# Altium project Drone_PCB.PrjPcb
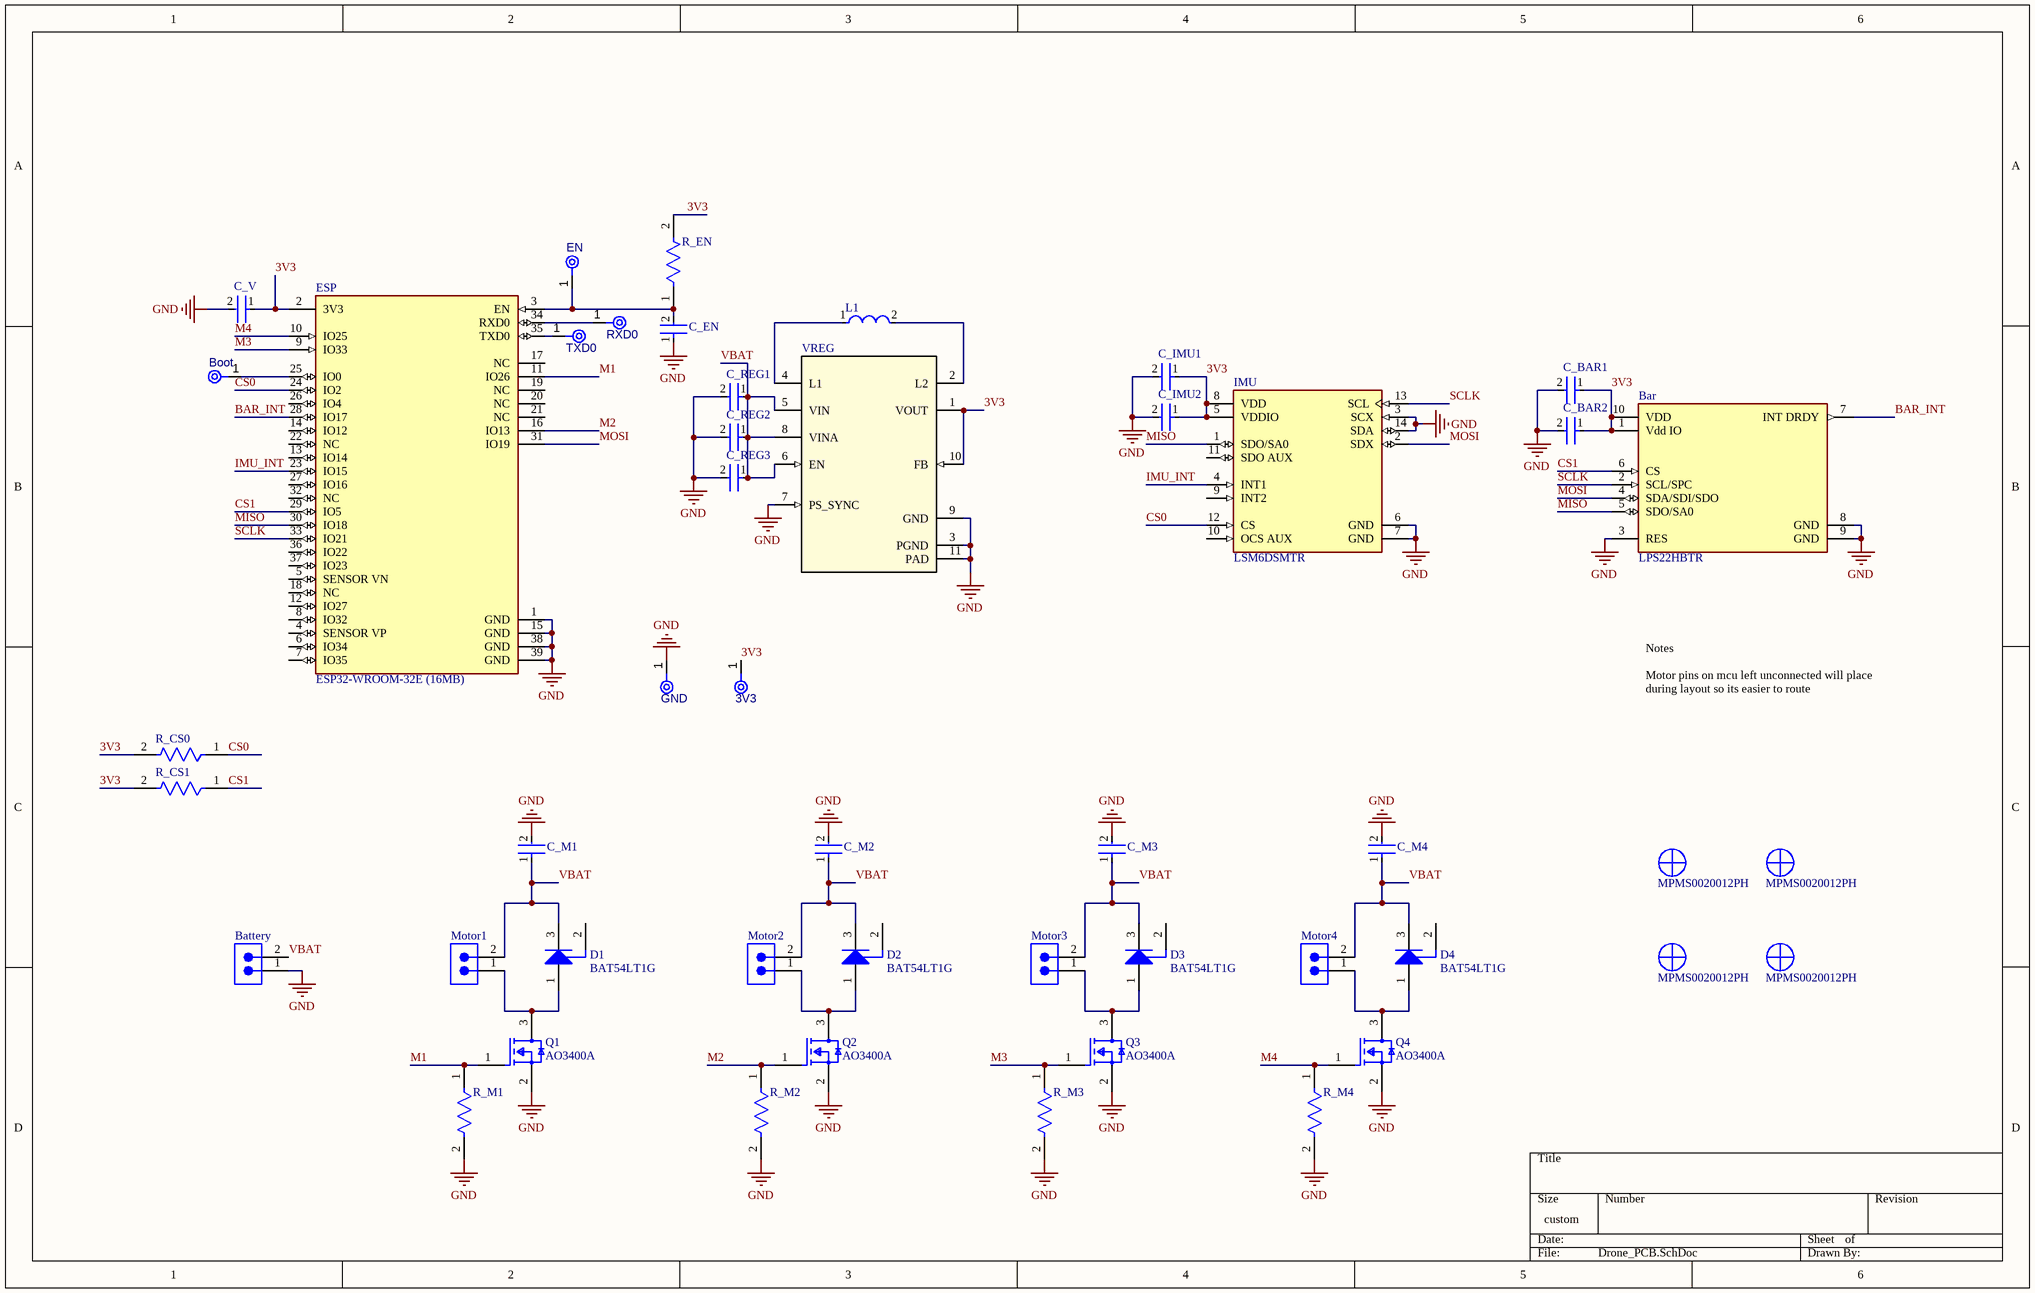
[diagram p0: Drone_PCB.SchDoc]
1 sheet, 48 parts. Net scope: global (net labels, ports and power ports of the same name join across sheets).
Board file: Drone_PCB.PcbDoc

## Sheet Drone_PCB.SchDoc
size 381 x 241 mm; SheetNumber: 1; SheetTotal: 1

### Parts
3V3  (no value)  [TP06R]  (no BOM)
Bar  LPS22HBTR  [FP-HLGA-10L-8479831-0]
Battery  (no value)  [61300211121]
Boot  (no value)  [TP06R]  (no BOM)
C_BAR1  (no value)  [FP-CL93-IPC_C]
C_BAR2  (no value)  [FP-CL93-IPC_C]
C_EN  (no value)  [FP-CL93-IPC_C]
C_IMU1  (no value)  [FP-CL93-IPC_C]
C_IMU2  (no value)  [FP-CL93-IPC_C]
C_M1  (no value)  [FP-CL93-IPC_C]
C_M2  (no value)  [FP-CL93-IPC_C]
C_M3  (no value)  [FP-CL93-IPC_C]
C_M4  (no value)  [FP-CL93-IPC_C]
C_REG1  (no value)  [FP-CL93-IPC_C]
C_REG2  (no value)  [FP-CL93-IPC_C]
C_REG3  (no value)  [FP-CL93-IPC_C]
C_V  (no value)  [FP-CL93-IPC_C]
D1  BAT54LT1G  [ONSC-SOT-23-3-318-08_V]
D2  BAT54LT1G  [ONSC-SOT-23-3-318-08_V]
D3  BAT54LT1G  [ONSC-SOT-23-3-318-08_V]
D4  BAT54LT1G  [ONSC-SOT-23-3-318-08_V]
EN  (no value)  [TP06R]  (no BOM)
ESP  ESP32-WROOM-32E (16MB)  [FP-ESP32-WROOM-32E_16MB-MFG]
GND  (no value)  [TP06R]  (no BOM)
IMU  LSM6DSMTR  [FP-LGA-14L-DM00249496-MFG]
L1  (no value)  [FP-MLZ2012-1_25-IPC_A]
MH1  MPMS0020012PH  [BF-MPMS0020012PH]
MH2  MPMS0020012PH  [BF-MPMS0020012PH]
MH3  MPMS0020012PH  [BF-MPMS0020012PH]
MH4  MPMS0020012PH  [BF-MPMS0020012PH]
Motor1  (no value)  [61300211121]
Motor2  (no value)  [61300211121]
Motor3  (no value)  [61300211121]
Motor4  (no value)  [61300211121]
Q1  AO3400A  [FP-SOT23-MFG]
Q2  AO3400A  [FP-SOT23-MFG]
Q3  AO3400A  [FP-SOT23-MFG]
Q4  AO3400A  [FP-SOT23-MFG]
R_CS0  (no value)  [FP-RC0603-0_55-MFG]
R_CS1  (no value)  [FP-RC0603-0_55-MFG]
R_EN  (no value)  [FP-RC0603-0_55-MFG]
R_M1  (no value)  [FP-RC0603-0_55-MFG]
R_M2  (no value)  [FP-RC0603-0_55-MFG]
R_M3  (no value)  [FP-RC0603-0_55-MFG]
R_M4  (no value)  [FP-RC0603-0_55-MFG]
RXD0  (no value)  [TP06R]  (no BOM)
TXD0  (no value)  [TP06R]  (no BOM)
VREG  TPS63031DSKR  [DSK0010A]  (value not drawn)

### Nets
GND: Bar.3(RES) Bar.8(GND) Bar.9(GND) Battery.1 C_BAR1.2 C_BAR2.2 C_EN.1 C_IMU1.2 C_IMU2.2 C_M1.2 C_M2.2 C_M3.2 C_M4.2 C_REG1.2 C_REG2.2 C_REG3.2 C_V.2 ESP.1(GND) ESP.15(GND) ESP.38(GND) ESP.39(GND) GND.1(TP) IMU.3(SCX) IMU.6(GND) IMU.7(GND) IMU.14(SDA) Q1.2(S) Q2.2(S) Q3.2(S) Q4.2(S) R_M1.2 R_M2.2 R_M3.2 R_M4.2 VREG.3(PGND) VREG.7(PS_SYNC) VREG.9(GND) VREG.11(PAD)
3V3: 3V3.1(TP) Bar.1(Vdd_IO) Bar.10(VDD) C_BAR1.1 C_BAR2.1 C_IMU1.1 C_IMU2.1 C_V.1 ESP.2(3V3) IMU.5(VDDIO) IMU.8(VDD) R_CS0.2 R_CS1.2 R_EN.2 VREG.1(VOUT) VREG.10(FB)
BAR_INT: Bar.7(INT_DRDY) ESP.28(IO17)
CS0: ESP.24(IO2) IMU.12(CS) R_CS0.1
CS1: Bar.6(CS) ESP.29(IO5) R_CS1.1
IMU_INT: ESP.23(IO15) IMU.4(INT1)
M1: ESP.11(IO26) Q1.1(G) R_M1.1
M2: ESP.16(IO13) Q2.1(G) R_M2.1
M3: ESP.9(IO33) Q3.1(G) R_M3.1
M4: ESP.10(IO25) Q4.1(G) R_M4.1
MISO: Bar.5(SDO/SA0) ESP.30(IO18) IMU.1(SDO/SA0)
MOSI: Bar.4(SDA/SDI/SDO) ESP.31(IO19) IMU.2(SDX)
SCLK: Bar.2(SCL/SPC) ESP.33(IO21) IMU.13(SCL)
VBAT: Battery.2 C_M1.1 C_M2.1 C_M3.1 C_M4.1 C_REG1.1 C_REG2.1 C_REG3.1 D1.3(K) D2.3(K) D3.3(K) D4.3(K) Motor1.2 Motor2.2 Motor3.2 Motor4.2 VREG.5(VIN) VREG.6(EN) VREG.8(VINA)
NetBoot_1: Boot.1(TP) ESP.25(IO0)
NetC_EN_2: C_EN.2 EN.1(TP) ESP.3(EN) R_EN.1
NetD1_1: D1.1(A) Motor1.1 Q1.3(D)
NetD2_1: D2.1(A) Motor2.1 Q2.3(D)
NetD3_1: D3.1(A) Motor3.1 Q3.3(D)
NetD4_1: D4.1(A) Motor4.1 Q4.3(D)
NetESP_34: ESP.34(RXD0) RXD0.1(TP)
NetESP_35: ESP.35(TXD0) TXD0.1(TP)
NetL1_1: L1.1 VREG.4(L1)
NetL1_2: L1.2 VREG.2(L2)

Not connected (* = marked no-connect by the designer): D1 2(NC); D2 2(NC); D3 2(NC); D4 2(NC); ESP 4(SENSOR_VP) 5(SENSOR_VN) 6(IO34) 7(IO35) 8(IO32) 12(IO27) 13(IO14) 14(IO12) 17(NC) 18(NC) 19(NC) 20(NC) 21(NC) 22(NC) 26(IO4) 27(IO16) 32(NC) 36(IO22) 37(IO23); IMU 9(INT2) 10(OCS_AUX) 11(SDO_AUX); MH1 1; MH2 1; MH3 1; MH4 1

### Notes on the sheet
- Notes
  Motor pins on mcu left unconnected will place during layout so its easier to route

### Library data of the parts
3V3 Boot EN GND RXD0 TXD0 = CMP-00028-00002-2: 0.6mm round; Pins: 1
Bar = CMP-12182-000004-1: MEMS NANO PRESSURE SENSOR: 260-1; Manufacturer: STMicroelectronics; Sensor Output: I2C,SPI; Port Style: No Port; Max Supply Voltage: 3.6V; Operating Supply Current: 3-12uA; Min Supply Voltage: 1.7V; Device Class L3: unset; Device Class L1: Sensors; Manufacturer Part Number: LPS22HBTR; Temperature Range High: +85°C; Digikey Description: MEMS NANO PRESSURE SENSOR: 260-1; Device Class L2: Pressure Sensors; RoHS: TRUE; Lead Free: Yes; Height: 0.8mm; Automotive: No; Octopart: https://octopart.com/lps22hbtr-stmicroelectronics-51851131; Package: HLGA-10L-8479831; Temperature Range Low: -40°C; Category: IC; Temperature: -40°C to +85°C; ComponentLink2Description: Datasheet; ComponentLink2URL: https://www.st.com/resource/en/datasheet/lps22hb.pdf; Footprint Url: https://www.st.com/content/ccc/resource/technical/document/technical_note/73/17/9c/16/dd/96/4a/01/CD00134799.pdf/files/CD00134799.pdf/jcr:content/translations/en.CD00134799.pdf
Battery Motor1-Motor4 = CMP-1712-00002-7: THT Vertical Pin Header WR-PHD, Pitch 2.54 mm, Single Row, 2 pins; Pitch: 2.54mm; Number of Contacts: 2; Connector Type: Male Pin; Gender: Male; Contact Resistance: 20mΩ; Operating Supply Voltage: 250V; Current Rating: 3A; Housing Material: PBT; RoHS: Compliant; Lead Free: Lead Free; Contact Material: Gold; REACH SVHC: No; Min Operating Temperature: -40°C; Termination: Through Hole; Number of Pins: 2; Contact Gender: Male; Packaging: Bulk; Lead Pitch: 2.54mm; Contact Plating: Gold; Orientation: Vertical; Mount: Through Hole; Height: 8.94mm; Color: Black; Number of Positions: 2; Contact Mating Length: 5.9944mm; Max Operating Temperature: 105°C; Voltage Rating: 250V; Number of Rows: 1
C_BAR1 C_BAR2 C_EN C_IMU1 C_IMU2 C_M1-C_M4 C_REG1-C_REG3 C_V = CMP-13271-000610-1: Cap Ceramic 100nF 10V X7R ±10% SMD 0402 +125°C Paper T/R
D1-D4 = CMP-1055-00534-1: Schottky Barrier Diode, 3-Pin SOT-23, Pb-Free, Tape and Reel; Manufacturer: On Semiconductor; IFSM Max (A): 0.6; Configuration: Single; trr Max (ns): 5; PackageVersion: Rev. AP, 11/2009; ComponentLink3Description: Package Specification; RoHS: TRUE; ComponentLink3URL: http://www.onsemi.cn/pub_link/Collateral/318-08.PDF; PackageDescription: 3-Pin Small Outline Transistor, Body 2.92 x 1.3 mm, Pitch 0.95 mm; DatasheetVersion: Rev. 12; ComponentLink1Description: Manufacturer URL; PartNumber: BAT54LT1G; ComponentLink2Description: Datasheet; Mounting Technology: Surface Mount; PackageReference: SOT-23-3-318-08; ComponentLink2URL: http://www.onsemi.cn/pub_link/Collateral/BAT54LT1-D.PDF; ComponentLink1URL: http://www.onsemi.com/; Packing: Tape and Reel
ESP = CMP-194065-000027-1: RX TXRX MOD WIFI TRACE ANT SMD
IMU = CMP-12177-000008-1: IMU ACCEL/GYRO I2C/SPI 14LGA; Manufacturer: STMicroelectronics; Operating Supply Current: 0.29-0.65mA; Gyro Range: 125/250/500/1000/2000°/s; Sensor Output: I2C,SPI; Accel Range: 2/4/8/16g; Min Supply Voltage: 1.62V; Resolution: 16bits; Sensor Type: Temperature,Accelerometer,Gyroscope; Max Supply Voltage: 3.6V; Manufacturer Part Number: LSM6DSMTR; Octopart: https://octopart.com/lsm6dsmtr-stmicroelectronics-66358194; Height: 0.86mm; Category: IC; Lead Free: Yes; Temperature: -40°C to +85°C; Temperature Range Low: -40°C; ComponentLink2Description: Datasheet; ComponentLink2URL: https://www.st.com/resource/en/datasheet/lsm6dsm.pdf; Digikey Description: IMU ACCEL/GYRO I2C/SPI 14LGA; Footprint Url: https://www.st.com/content/ccc/resource/technical/document/technical_note/73/17/9c/16/dd/96/4a/01/CD00134799.pdf/files/CD00134799.pdf/jcr:content/translations/en.CD00134799.pdf; Device Class L1: Sensors; Device Class L2: Motion Sensors; Temperature Range High: +85°C; Mouser Description: LSM6DSM Series 3.6 V I2C/SPI 3D Accelerometer and 3D Gyroscope - LGA-14; Device Class L3: Inertial Measurement Units (IMUs); Automotive: No; Package: LGA-14L-DM00249496; RoHS: TRUE
L1 = CMP-08253-000093-1: Shielded Multilayer Inductor 2.2uH ±20% 600mA 208mΩ SMD 0805; Core Material: Ferrite; Self Resonant Frequency: 100MHz; DC Resistance (DCR): 208mR; Test Frequency: 2MHz; Saturation Current: 400mA; Length: 0.079inch; Mount: Surface Mount; Current Rating: 600mA; Height - Seated (Max): 0.041inch; Lead Free: Lead Free; Min Operating Temperature: -55°C; Width: 0.049inch; Tolerance: 20%; Case Code (Metric): 2012; Case/Package: 0805; Package Quantity: 2000; Packaging: Tape and Reel; RoHS Compliant: Yes; Shielding: Shielded; Max Operating Temperature: 125°C; Case Code (Imperial): 0805; Inductance: 2.2uH
MH1-MH4 = CMP-00028-00000-2: Copper Pillar, M2 Screw; Manufacturer: B&F Fastener Supply; Drive Type: Phillips; Screw Head Type: PanHead
Q1-Q4 = CMP-83955-000006-1: MOSFET N-CH 30V 5.7A SOT23; Input Capacitance: 630pF; Number of Elements: 1; Rds On Max: 26.5mR; Max Power Dissipation: 1.4W; Gate to Source Voltage (Vgs): 12V; Min Operating Temperature: -55°C; Lead Free: Lead Free; Number of Pins: 3; Drain to Source Voltage (Vdss): 30V; Case/Package: SOT-23; Mount: Surface Mount; Continuous Drain Current (ID): 5.7A; Radiation Hardening: No; Packaging: Tape and Reel; Max Operating Temperature: 150°C; Power Dissipation: 1.4W
R_CS0 R_CS1 R_EN R_M1-R_M4 = CMP-2100-03662-2: RES SMD 100K OHM 1% 1/10W 0603; Voltage Rating (DC): 50V; Resistance: 100kR; Max Power Dissipation: 100mW; Temperature Coefficient: 100ppm/°C; Working Voltage: 75V; Length: 1.6mm; Lead Free: Lead Free; Number of Terminations: 2; Packaging: Tape and Reel; Voltage Rating: 50V; Termination: SMD/SMT; Width: 0.8mm; Resistor Type: Thick Film; Resistance Tolerance: 1%; Features: Moisture Resistant; Height: 0.45mm; Construction: Rectangular; Case/Package: 0603; Military Standard: Not; Case Code (Imperial): 0603; Series: RC; Technology: THICK FILM; Depth: 0.8mm; RoHS Compliant: Yes; REACH SVHC: No SVHC; Min Operating Temperature: -55°C; Case Code (Metric): 1608; Max Operating Temperature: 155°C; Power Rating: 100mW; Number of Pins: 2; Tolerance: 1%
VREG = CMP-006-00021-1: High Efficient Single Inductor Buck-Boost Converter with 1-A Switches 10-SON -40 to 125; Manufacturer_Name: Texas Instruments; Alternate_PartNumber: TPS63031DSKT; CompType: IC; Source: TPS63031DSKR.SchLib; PartNumber: TPS63031DSKR; Application_BuildNumber: *; Design Item ID: TPS63031DSKR; Case/Package: DSK0010A; Copyright: Copyright (C) 2026 Ultra Librarian. All rights reserved.; Manufacturer_Part_Number: TPS63031DSKR; RoHS: Y; MountType: SMT; RefDes: RefDes; TYPE: TYPE; Manufacturer: Texas Instruments